# Altium schematic sheet DAC.SchDoc: ESP32 - ANALOG BOARD
size A2; Author: Luca Schenetti; DrawnBy: Luca Schenetti; Engineer: Luca Schenetti; Revision: B; SheetNumber: 5; SheetTotal: 7
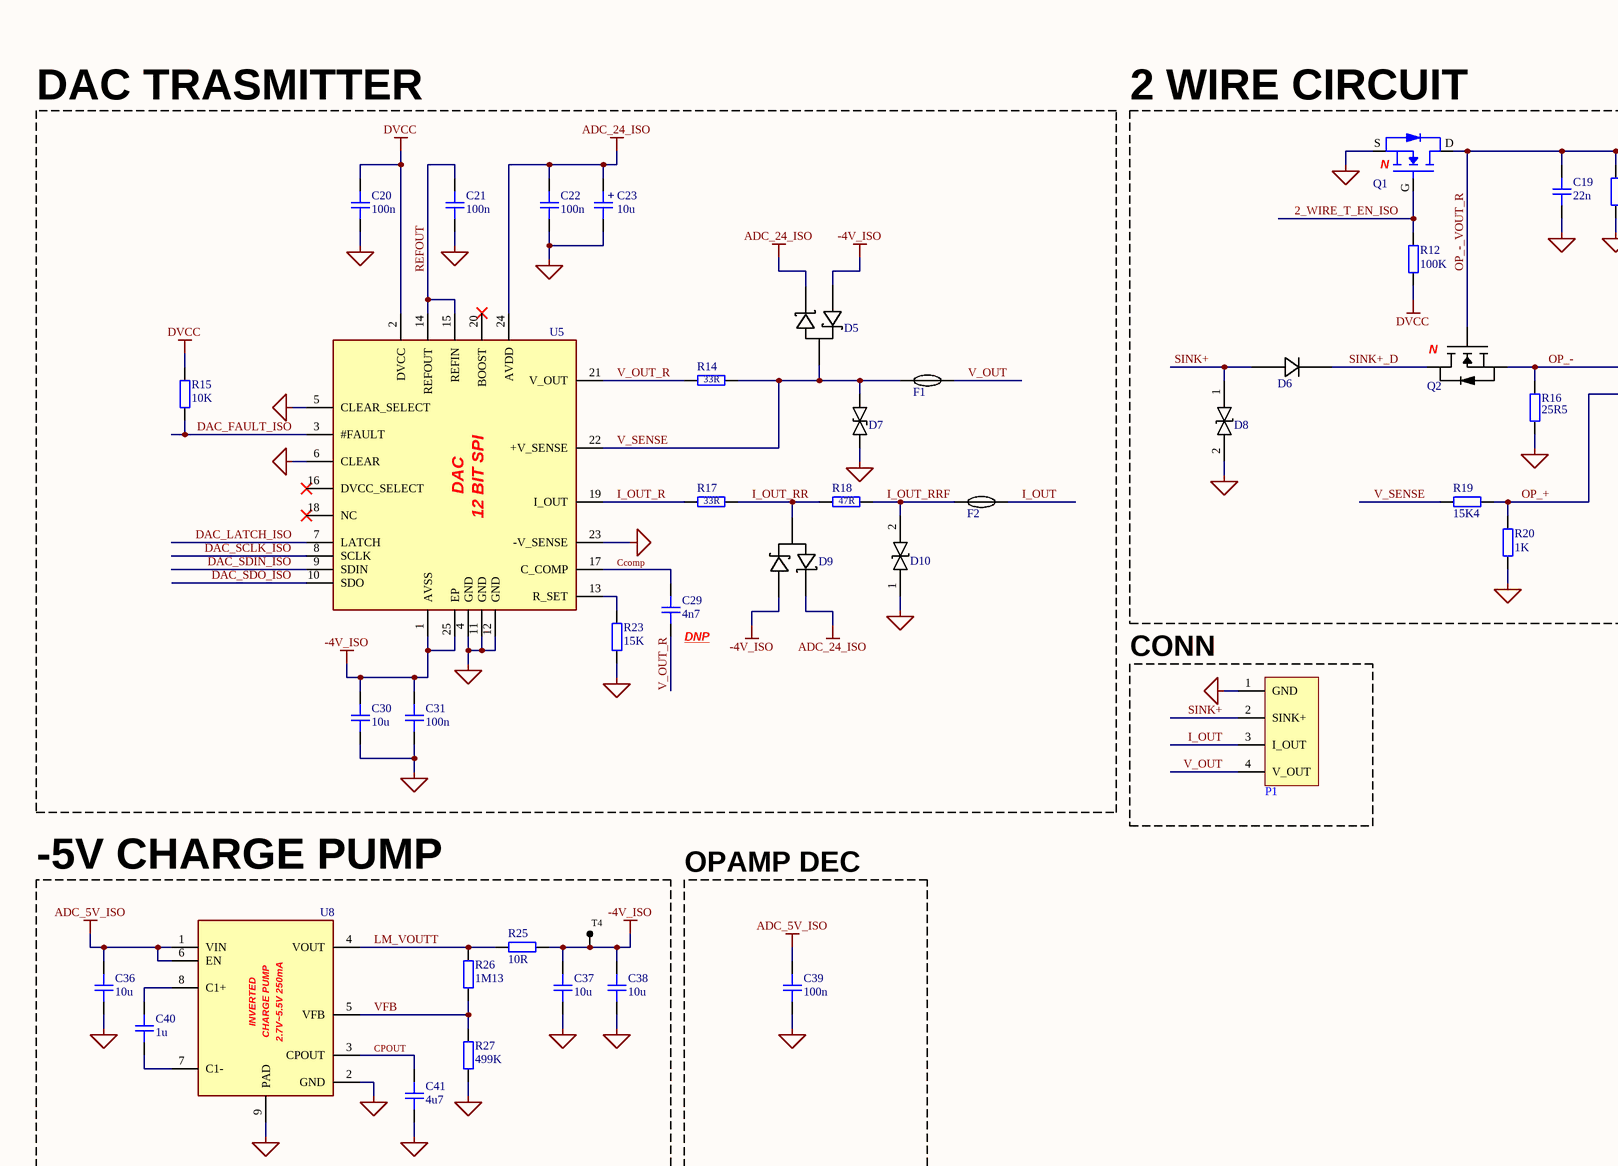
[diagram p0: DAC.SchDoc, top left]
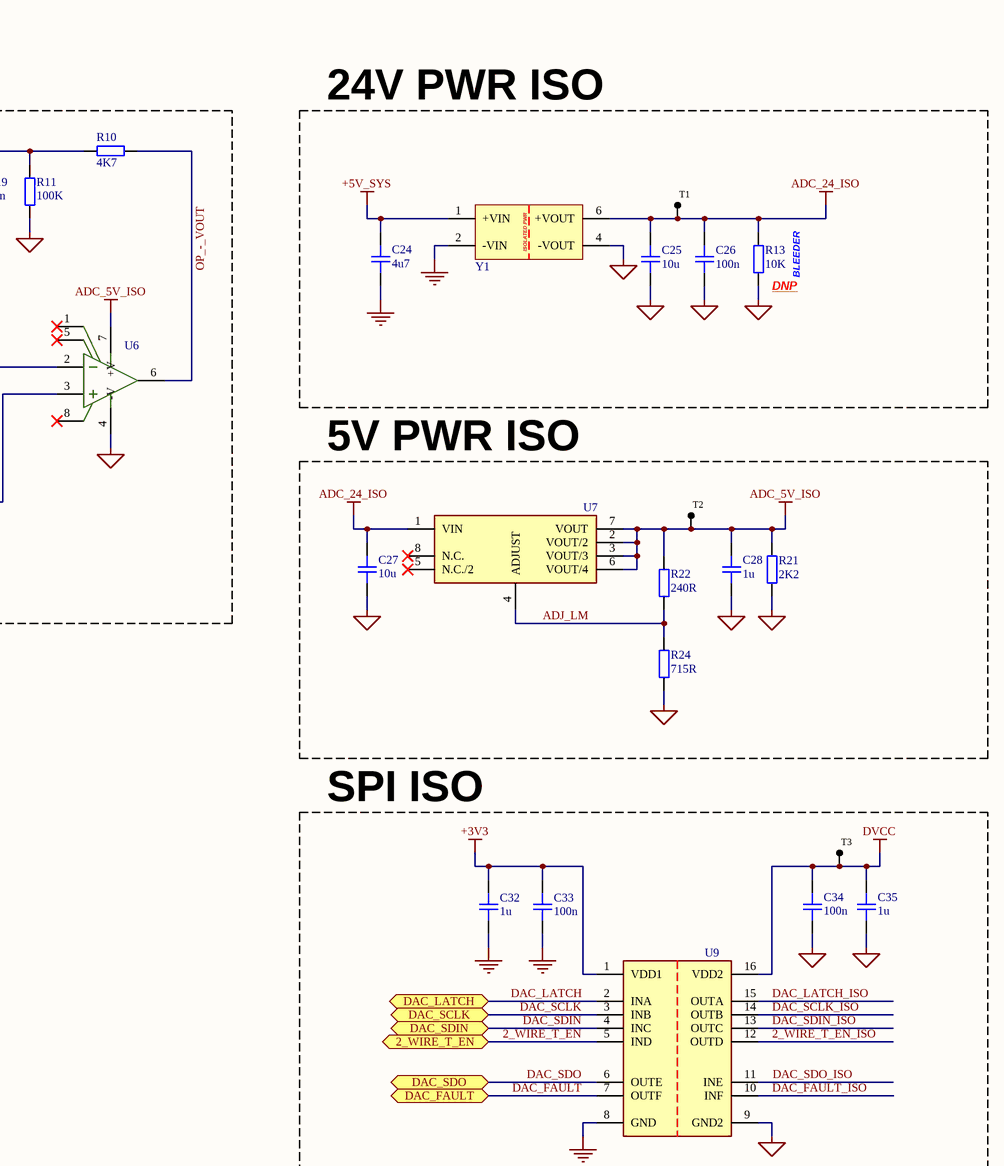
[diagram p1: DAC.SchDoc, top middle]
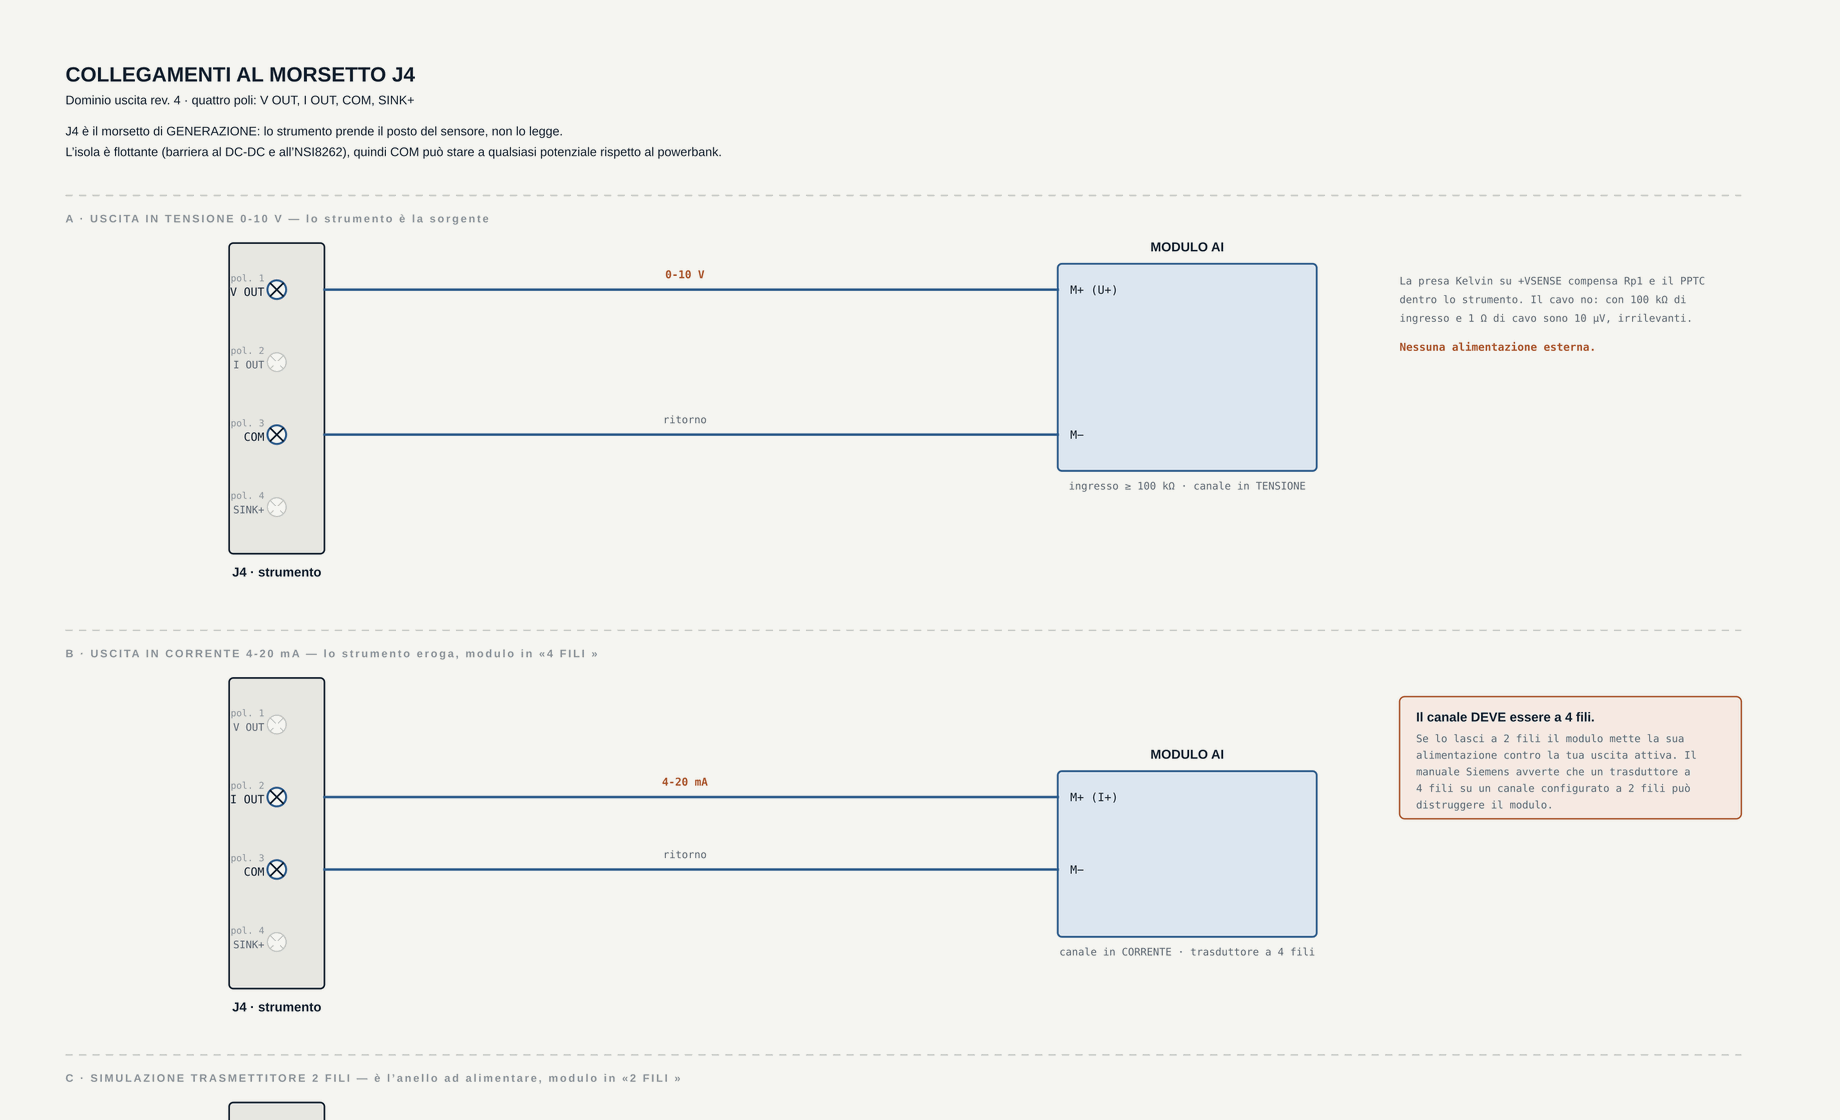
[diagram p2: DAC.SchDoc, top right]
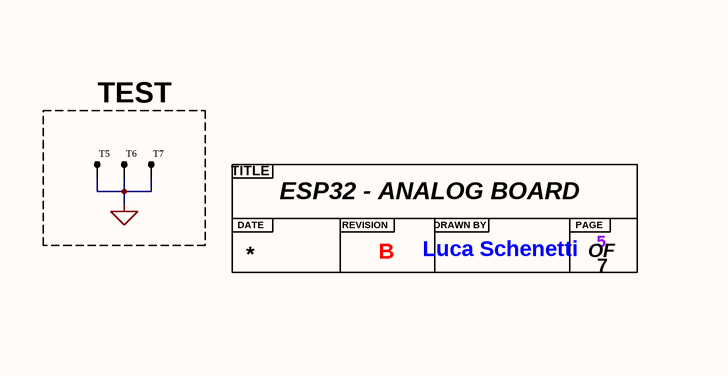
[diagram p3: DAC.SchDoc, bottom middle]
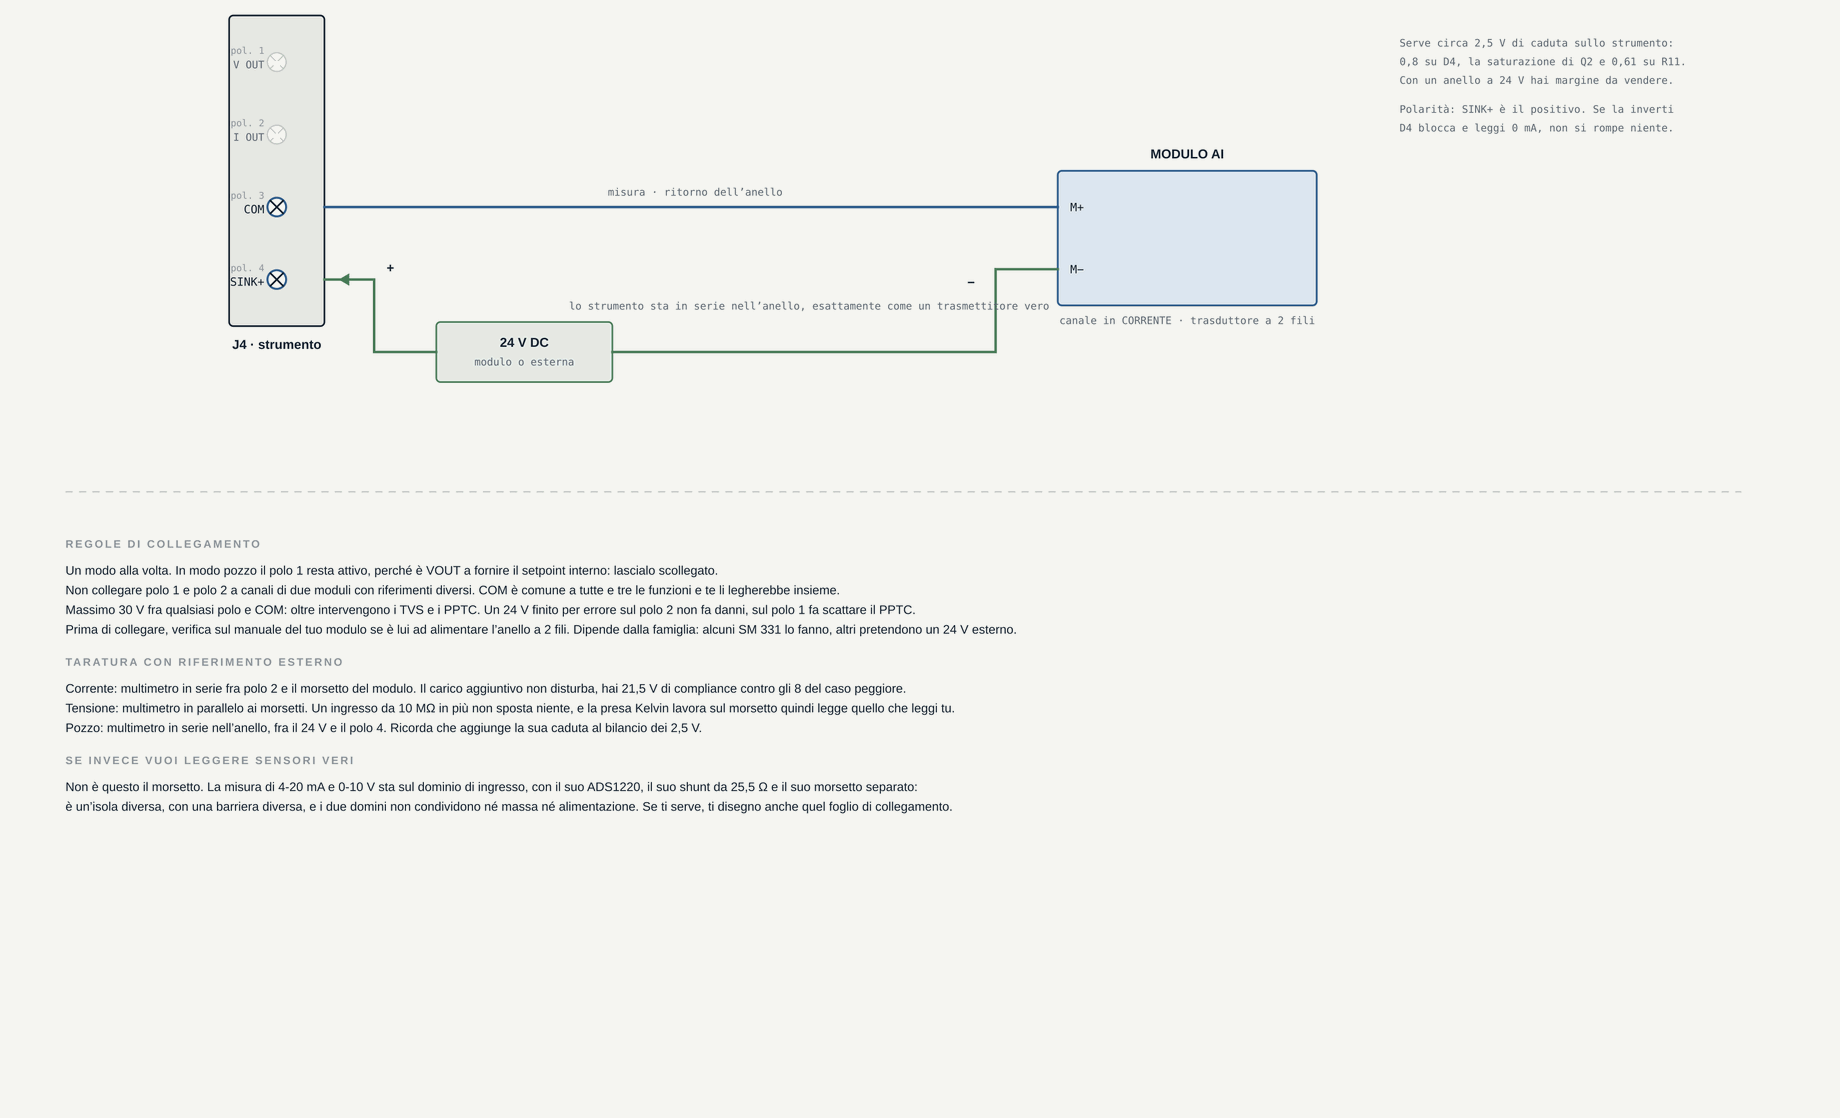
[diagram p4: DAC.SchDoc, bottom right]

## Parts
?  Title  (value not drawn)  (graphical)
C19  22n  [CAP_0402]
C20  100n  [CAP_0402]
C21  100n  [CAP_0402]
C22  100n  [CAP_0402]
C23  10u  [CAP_ALEL_5x5.4]
C24  4u7  [CAP_0805]
C25  10u  [CAP_0805]
C26  100n  [CAP_0603]
C27  10u  [CAP_0805]
C28  1u  [CAP_0805]
C29  4n7  [CAP_0402]  (no BOM)
C30  10u  [CAP_0603]
C31  100n  [CAP_0402]
C32  1u  [CAP_0402]
C33  100n  [CAP_0402]
C34  100n  [CAP_0402]
C35  1u  [CAP_0402]
C36  10u  [CAP_0603]
C37  10u  [CAP_0603]
C38  10u  [CAP_0603]
C39  100n  [CAP_0402]
C40  1u  [CAP_0402]
C41  4u7  [CAP_0402]
D5  Schottky Diodes  [BAT54S]  (value not drawn)
D6  DIODE 300mA 75V  [1N4148W]  (value not drawn)
D7  TVS 30V Bidirectional  [SMBJ30CA]  (value not drawn)
D8  BIDI TVS 36V  [SMAJ33CA]  (value not drawn)
D9  Schottky Diodes  [BAT54S]  (value not drawn)
D10  BIDI TVS 30V  [SMAJ30CA]  (value not drawn)
F1  PPTC 100mA 60V  [JK-nSMD010/60V]  (value not drawn)
F2  PPTC 100mA 60V  [JK-nSMD010/60V]  (value not drawn)
P1  WJ500V-5.08-4P  [WJ500V-5.08-4P]  (value not drawn)
Q1  N-Channel Vgs=30V 5.7A  [AO3400A]  (value not drawn)
Q2  NPN MOSFET 100V  [IRLR3110ZTRPBF]  (value not drawn)
R10  4K7  [RES_0603]
R11  100K  [RES_0603]
R12  100K  [RES_0402]
R13  10K  [RES_0805]
R14  33R  [RES_0603]
R15  10K  [RES_0402]
R16  25R5  [RES_2512]
R17  33R  [RES_0603]
R18  47R  [RES_0603]
R19  15K4  [RES_0603]
R20  1K  [RES_0603]
R21  2K2  [RES_0603]
R22  240R  [RES_0603]
R23  15K  [RES_0805]
R24  715R  [RES_0603]
R25  10R  [RES_0402]
R26  1M13  [RES_0402]
R27  499K  [RES_0402]
T1  TP_S  [TP 1mm]  (value not drawn)  (no BOM)
T2  TP_S  [TP 1mm]  (value not drawn)  (no BOM)
T3  TP_S  [TP 1mm]  (value not drawn)  (no BOM)
T4  TP_S  [TP 1mm]  (value not drawn)  (no BOM)
T5  TP_S  [TP 1mm]  (value not drawn)  (no BOM)
T6  TP_S  [TP 1mm]  (value not drawn)  (no BOM)
T7  TP_S  [TP 1mm]  (value not drawn)  (no BOM)
U5  Digital to Analog Converters 12 SPI Voltage Buffer  [AD5412AREZ-REEL7]  (value not drawn)
U6  Precision Op Amps  [OP184ESZ-REEL7]  (value not drawn)
U7  LDO 100mA 2,2-37V  [LM317LDR2G]  (value not drawn)
U8  INVERTED CHARGE PUMP 2.7V~5.5V  [LM27761DSGR]  (value not drawn)
U9  Digital Isolators 4 IN - 2 OUT  [NSI8262W1-DSWR]  (value not drawn)
Y1  Isolated Power IN 4.5V~5.5V OUT 24V 2W  [B0524S-2WR3]  (value not drawn)

## Blocks framed on the sheet
DAC TRASMITTER: C20-C23 C29-C31 D5 D7 D9 D10 F1 F2 R14 R15 R17 R18 R23 U5
2 WIRE CIRCUIT: C19 D6 D8 Q1 Q2 R10-R12 R16 R19 R20 U6
24V PWR ISO: C24-C26 R13 T1 Y1
5V PWR ISO: C27 C28 R21 R22 R24 T2 U7
SPI ISO: C32-C35 T3 U9
-5V CHARGE PUMP: C36-C38 C40 C41 R25-R27 T4 U8
OPAMP DEC: C39
TEST: T5-T7

## Ports
2_WIRE_T_EN (bidir, see MCU[3C]), DAC_FAULT (bidir, see MCU[3B]), DAC_LATCH (bidir, see MCU[3B]), DAC_SCLK (bidir, see MCU[3B]), DAC_SDIN (bidir, see MCU[3B]), DAC_SDO (bidir, see MCU[3B])

## Nets
+3V3: C32.2 C33.2 U9.1(VDD1)
+5V_SYS: C24.2 Y1.1(+VIN)
-4V_ISO: C30.2 C31.2 C37.2 C38.2 D5.1(K1) D9.1(K1) R25.2 T4.1 U5.1(AVSS) U5.25(EP)
ADC_5V_ISO: C28.2 C36.2 C39.2 R21.2 R22.2 T2.1 U6.7(+V) U7.2(VOUT/2) U7.3(VOUT/3) U7.6(VOUT/4) U7.7(VOUT) U8.1(VIN) U8.6(EN)
ADC_24_ISO: C22.2 C23.1 C25.2 C26.2 C27.1 D5.2(K2) D9.2(K2) R13.2 T1.1 U5.24(AVDD) U7.1(VIN) Y1.6(+VOUT)
DVCC: C20.2 C34.2 C35.2 R12.1 R15.2 T3.1 U5.2(DVCC) U9.16(VDD2)
GND: C24.1 C32.1 C33.1 U9.8(GND) Y1.2(-VIN)
GND_2: C19.1 C20.1 C21.1 C22.1 C23.2 C25.1 C26.1 C27.2 C28.1 C30.1 C31.1 C34.1 C35.1 C36.1 C37.1 C38.1 C39.1 C41.1 D7.2(A) D8.2 D10.1 P1.1(GND) Q1.S R11.2 R13.1 R16.2 R20.1 R21.1 R23.1 R24.1 R27.1 T5.1 T6.1 T7.1 U5.4(GND) U5.5(CLEAR_SELECT) U5.6(CLEAR) U5.11(GND) U5.12(GND) U5.23(-V_SENSE) U6.4(-V) U8.2(GND) U8.9(PAD) U9.9(GND2) Y1.4(-VOUT)
2_WIRE_T_EN: U9.5(IND) ; port 2_WIRE_T_EN
2_WIRE_T_EN_ISO: Q1.G R12.2 U9.12(OUTD)
ADJ_LM: R22.1 R24.2 U7.4(ADJUST)
Ccomp: C29.2 U5.17(C_COMP)
CPOUT: C41.2 U8.3(CPOUT)
DAC_FAULT: U9.7(OUTF) ; port DAC_FAULT
DAC_FAULT_ISO: R15.1 U5.3(#FAULT) U9.10(INF)
DAC_LATCH: U9.2(INA) ; port DAC_LATCH
DAC_LATCH_ISO: U5.7(LATCH) U9.15(OUTA)
DAC_SCLK: U9.3(INB) ; port DAC_SCLK
DAC_SCLK_ISO: U5.8(SCLK) U9.14(OUTB)
DAC_SDIN: U9.4(INC) ; port DAC_SDIN
DAC_SDIN_ISO: U5.9(SDIN) U9.13(OUTC)
DAC_SDO: U9.6(OUTE) ; port DAC_SDO
DAC_SDO_ISO: U5.10(SDO) U9.11(INE)
I_OUT: F2.2 P1.3(I_OUT)
I_OUT_R: R17.1 U5.19(I_OUT)
I_OUT_RR: D9.3(A) R17.2 R18.1
I_OUT_RRF: D10.2 F2.1 R18.2
LM_VOUTT: R25.1 R26.2 U8.4(VOUT)
OP_+: R19.1 R20.2 U6.3(+IN_A)
OP_-: Q2.3(S) R16.1 U6.2(-IN_A)
OP_-_VOUT: R10.1 U6.6(OUT_A)
OP_-_VOUT_R: C19.2 Q1.D Q2.1(G) R10.2 R11.1
REFOUT: C21.2 U5.14(REFOUT) U5.15(REFIN)
SINK+: D6.2(A) D8.1 P1.2(SINK+)
SINK+_D: D6.1(C) Q2.2(D)
V_OUT: F1.2 P1.4(V_OUT)
V_OUT_R: C29.1 R14.1 U5.21(V_OUT)
V_SENSE: D5.3(A) D7.1(K) F1.1 R14.2 R19.2 U5.22(+V_SENSE)
VFB: R26.1 R27.2 U8.5(VFB)
NetC40_1: C40.1 U8.7(C1-)
NetC40_2: C40.2 U8.8(C1+)
NetR23_2: R23.2 U5.13(R_SET)

Not connected (* = marked no-connect by the designer): U5 16(DVCC_SELECT)* 18(NC)* 20(BOOST)*; U6 1(DNC)* 5(DNC)* 8(NC)*; U7 5(N.C./2)* 8(N.C.)*

## Notes on the sheet
- (near R13) DNP
- (near R13) BLEEDER
- (near C29) DNP
- CONN
- (in symbol AD5412AREZ-REEL7) DAC; 12 BIT SPI
- (in symbol AO3400A) N
- (in symbol B0524S-2WR3) ISOLATED PWR
- (in symbol CAP_ALEL_5x5.4) +
- (in symbol IRLR3110ZTRPBF) N
- (in symbol LM27761DSGR) INVERTED; CHARGE PUMP; 2.7V~5.5V 250mA
- (in symbol Title) TITLE; DATE; REVISION; DRAWN BY; PAGE; OF

## Library data of the parts
C19 = CAP_0402: [C1532]; Manufacturer: *; Manufacturer Part Number: *; Distributor Link: *; LCSC: *; Rating: *; Dielectric: *
C20-C22 C31 C33 C34 C39 = CAP_0402: [C307331]; Manufacturer: *; Manufacturer Part Number: *; Distributor Link: *; LCSC: *; Rating: *; Dielectric: *
C23 = CAP_ALEL_5x5.4: [C46550416]; Manufacturer: *; Manufacturer Part Number: *; Distributor Link: *; LCSC: *
C24 = CAP_0805: [C98192]; Manufacturer: *; Manufacturer Part Number: *; Distributor Link: *; LCSC: *; Rating: *; Dielectric: *
C25 C27 = CAP_0805: [C440198]; Manufacturer: *; Manufacturer Part Number: *; Distributor Link: *; LCSC: *; Rating: *; Dielectric: *
C26 = CAP_0603: [C307331]; Manufacturer: *; Manufacturer Part Number: *; Distributor Link: *; LCSC: *; Rating: *; Dielectric: *
C28 = CAP_0805: [C28323]; Manufacturer: *; Manufacturer Part Number: *; Distributor Link: *; LCSC: *; Rating: *; Dielectric: *
C29 = CAP_0402: [C1538]; Manufacturer: *; Manufacturer Part Number: *; Distributor Link: *; LCSC: *; Rating: *; Dielectric: *
C30 C36-C38 = CAP_0603: [C19702]; Manufacturer: *; Manufacturer Part Number: *; Distributor Link: *; LCSC: *; Rating: *; Dielectric: *
C32 C35 C40 = CAP_0402: [C52923]; Manufacturer: *; Manufacturer Part Number: *; Distributor Link: *; LCSC: *; Rating: *; Dielectric: *
C41 = CAP_0402: [C23733]; Manufacturer: *; Manufacturer Part Number: *; Distributor Link: *; LCSC: *; Rating: *; Dielectric: *
D5 D9 = BAT54S_C7420333: [C7420333]
D6 = 1N4148W: [C917030]
D7 = SMBJ30CA: [C83847]
D8 = SMAJ33CA: [C19077549]
D10 = SMAJ30CA: [C10755]
F1 F2 = JK-nSMD010/60V: [C2830236]
P1 = WJ500V-5.08-4P: [C2915641]; Manufacturer: KANGNEX(康奈克斯电气); Symbol: WJ500V-5.08-3P-14-00A; Device: WJ500V-5.08-3P; Add into BOM: yes; Structure: 1x3P; Pitch: 5.08mm; Current Rating (Max): 18A; Voltage Rating (Max): 250V; Wire Gauge - AWG: 14~30; Wire Gauge - mm2: 2.5; Number of PINs Per Row: 3; LCSC Part Name: 5.08mm 1x3P 排数:1 每排P数:3 直插; Supplier Part: C72334; Manufacturer Part: WJ500V-5.08-3P; Supplier Footprint: 插件,P=5.08mm; JLCPCB Part Class: Extended Part; Datasheet: https://atta.szlcsc.com/upload/public/pdf/source/20191225/C72334_8A5EF831D67650233B6B1E3F2BC06274.pdf; Supplier: LCSC; Convert to PCB: yes; Color: Green; Mounting Style: Straight; Number of Pins: 3P; Number of Rows: 1; Operating Temperature Range: -40℃~+105℃
Q1 = AO3400A: [C20917]
Q2 = IRLR3110ZTRPBF: [C67277]
R10 = RES_0603: [C23162]; Manufacturer: *; Manufacturer Part Number: *; Distributor Link: *; LCSC: *
R11 = RES_0603: [C25803]; Manufacturer: *; Manufacturer Part Number: *; Distributor Link: *; LCSC: *
R12 = RES_0402: [C25741]; Manufacturer: *; Manufacturer Part Number: *; Distributor Link: *; LCSC: *
R13 = RES_0805: [C17414]; Manufacturer: *; Manufacturer Part Number: *; Distributor Link: *; LCSC: *
R14 R17 = RES_0603: [C23140]; Manufacturer: *; Manufacturer Part Number: *; Distributor Link: *; LCSC: *
R15 = RES_0402: [C25744]; Manufacturer: *; Manufacturer Part Number: *; Distributor Link: *; LCSC: *
R16 = RES_2512: [C2775912]
R18 = RES_0603: [C23182]; Manufacturer: *; Manufacturer Part Number: *; Distributor Link: *; LCSC: *
R19 = RES_0603: [C2933150]; Manufacturer: *; Manufacturer Part Number: *; Distributor Link: *; LCSC: *
R20 = RES_0603: [C21190]; Manufacturer: *; Manufacturer Part Number: *; Distributor Link: *; LCSC: *
R21 = RES_0603: [C4190]; Manufacturer: *; Manufacturer Part Number: *; Distributor Link: *; LCSC: *
R22 = RES_0603: [C23350]; Manufacturer: *; Manufacturer Part Number: *; Distributor Link: *; LCSC: *
R23 = RES_0805: [C17475]; Manufacturer: *; Manufacturer Part Number: *; Distributor Link: *; LCSC: *
R24 = RES_0603: [C2998136]; Manufacturer: *; Manufacturer Part Number: *; Distributor Link: *; LCSC: *
R25 = RES_0402: [C25077]; Manufacturer: *; Manufacturer Part Number: *; Distributor Link: *; LCSC: *
R26 = RES_0402: [C51048313]; Manufacturer: *; Manufacturer Part Number: *; Distributor Link: *; LCSC: *
R27 = RES_0402: [C2998054]; Manufacturer: *; Manufacturer Part Number: *; Distributor Link: *; LCSC: *
T1-T7 = TP_S: test point
U5 = AD5412AREZ-REEL7: [C27993]
U6 = OP184ESZ-REEL7: [C209423]
U7 = LM317LDR2G: [C7940]
U8 = LM27761DSGR: [C129351]
U9 = NSI8262W1-DSWR: [C5441133]
Y1 = B0524S-2WR3: [C5369477]